# Altium project DTCP v3.0.PrjPcb (part 1 of 2)
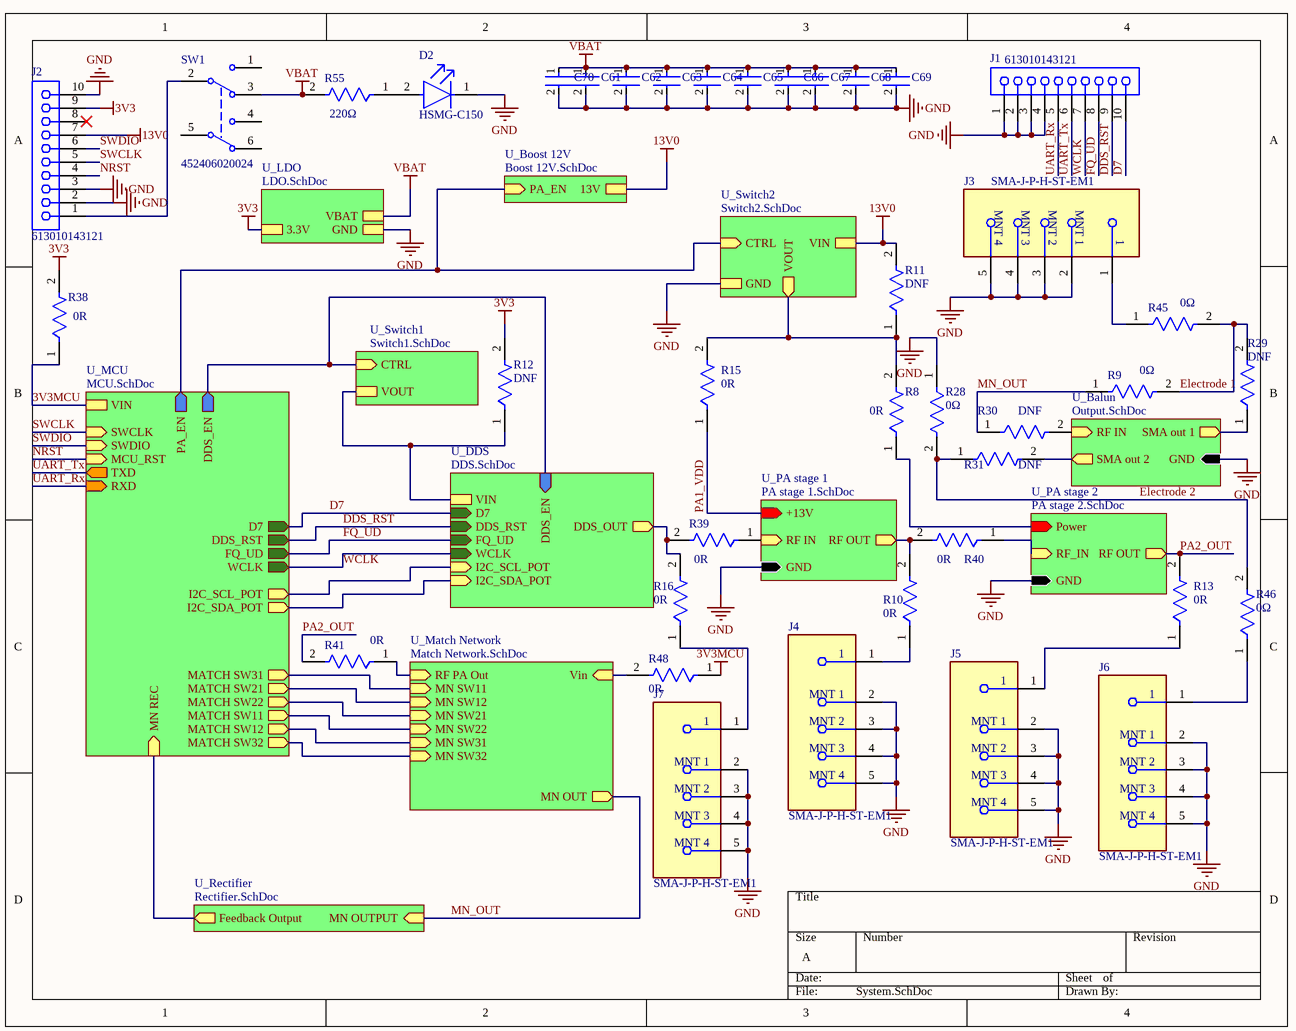
[diagram p0: System.SchDoc]
12 sheets, 165 parts. Net scope: hierarchical (ports join the sheet entries above them; power ports are global).
Board files: PCB1.PcbDoc, PCBv2.PcbDoc
Sheets:
  System.SchDoc
    U_MCU = MCU.SchDoc
    U_DDS = DDS.SchDoc
    U_PA stage 1 = PA stage 1.SchDoc
    U_PA stage 2 = PA stage 2.SchDoc
    U_LDO = LDO.SchDoc
    U_Boost 12V = Boost 12V.SchDoc
    U_Switch1 = Switch1.SchDoc
    U_Switch2 = Switch2.SchDoc
    U_Rectifier = Rectifier.SchDoc
    U_Balun = Output.SchDoc
    U_Match Network = Match Network.SchDoc

## Sheet System.SchDoc
size A; SheetNumber: 1; SheetTotal: 12

### Parts
C61  GRM21BR60J107ME15K  [FP-GRM21B-0_2-e0_2_0_7-IPC_B]  (value not drawn)
C62  GRM21BR60J107ME15K  [FP-GRM21B-0_2-e0_2_0_7-IPC_B]  (value not drawn)
C63  GRM21BR60J107ME15K  [FP-GRM21B-0_2-e0_2_0_7-IPC_B]  (value not drawn)
C64  GRM21BR60J107ME15K  [FP-GRM21B-0_2-e0_2_0_7-IPC_B]  (value not drawn)
C65  GRM21BR60J107ME15K  [FP-GRM21B-0_2-e0_2_0_7-IPC_B]  (value not drawn)
C66  GRM21BR60J107ME15K  [FP-GRM21B-0_2-e0_2_0_7-IPC_B]  (value not drawn)
C67  GRM21BR60J107ME15K  [FP-GRM21B-0_2-e0_2_0_7-IPC_B]  (value not drawn)
C68  GRM21BR60J107ME15K  [FP-GRM21B-0_2-e0_2_0_7-IPC_B]  (value not drawn)
C69  GRM21BR60J107ME15K  [FP-GRM21B-0_2-e0_2_0_7-IPC_B]  (value not drawn)
C70  GRM21BR60J107ME15K  [FP-GRM21B-0_2-e0_2_0_7-IPC_B]  (value not drawn)
D2  HSMG-C150  [FP-HSMG-C150-MFG]
J1  613010143121  [613010143121]
J2  613010143121  [613010143121]
J3  SMA-J-P-H-ST-EM1  [FP-SMA-J-P-H-ST-EM1-MFG]
J4  SMA-J-P-H-ST-EM1  [FP-SMA-J-P-H-ST-EM1-MFG]
J5  SMA-J-P-H-ST-EM1  [FP-SMA-J-P-H-ST-EM1-MFG]
J6  SMA-J-P-H-ST-EM1  [FP-SMA-J-P-H-ST-EM1-MFG]
J7  SMA-J-P-H-ST-EM1  [FP-SMA-J-P-H-ST-EM1-MFG]
R8  Resistance: 0R  [FP-RMCF0603-IPC_B]  (hidden comment: RMCF0603ZG0R00)
R9  Resistance: 0Ω  [FP-RMCF0603-IPC_B]  (hidden comment: RMCF0603ZG0R00)
R10  Resistance: 0R  [FP-RMCF0603-IPC_B]  (hidden comment: RMCF0603ZG0R00)
R11  DNF  [FP-RMCF0603-IPC_B]
R12  DNF  [FP-RMCF0603-IPC_B]
R13  Resistance: 0R  [FP-RMCF0603-IPC_B]  (hidden comment: RMCF0603ZG0R00)
R15  Resistance: 0R  [FP-RMCF0603-IPC_B]  (hidden comment: RMCF0603ZG0R00)
R16  Resistance: 0R  [FP-RMCF0603-IPC_B]  (hidden comment: RMCF0603ZG0R00)
R28  Resistance: 0Ω  [FP-RMCF0603-IPC_B]  (hidden comment: RMCF0603ZG0R00)
R29  DNF  [FP-RMCF0603-IPC_B]
R30  DNF  [FP-RMCF0603-IPC_B]
R31  DNF  [FP-RMCF0603-IPC_B]
R38  Resistance: 0R  [FP-RMCF0603-IPC_B]  (hidden comment: DNF)
R39  Resistance: 0R  [FP-RMCF0603-IPC_B]  (hidden comment: DNF)
R40  Resistance: 0R  [FP-RMCF0603-IPC_B]  (hidden comment: DNF)
R41  Resistance: 0R  [FP-RMCF0603-IPC_B]  (hidden comment: DNF)
R45  Resistance: 0Ω  [FP-RMCF0603-IPC_B]  (hidden comment: RMCF0603ZG0R00)
R46  Resistance: 0Ω  [FP-RMCF0603-IPC_B]  (hidden comment: RMCF0603ZG0R00)
R48  Resistance: 0R  [FP-RMCF0603-IPC_B]  (hidden comment: DNF)
R55  Resistance: 220Ω  [FP-CRCW0603-HPe3-IPC_A]  (hidden comment: CRCW0603220RFKEAHP)
SW1  452406020024  [452406020024]

### Sub-sheets
U_Balun = Output.SchDoc: RF IN (in), SMA out 1 (out), SMA out 2 (out), GND (in)
U_Boost 12V = Boost 12V.SchDoc: PA_EN (in), 13V
U_DDS = DDS.SchDoc: DDS_OUT (out), D7 (in), DDS_RST (in), FQ_UD (in), WCLK (in), I2C_SCL_POT (in), I2C_SDA_POT (in), DDS_EN (in), VIN
U_LDO = LDO.SchDoc: 3.3V, VBAT, GND
U_Match Network = Match Network.SchDoc: RF PA Out (in), MN SW11 (in), MN SW12 (in), MN SW21 (in), MN OUT (out), Vin (in), MN SW22 (in), MN SW31 (in), MN SW32 (in)
U_MCU = MCU.SchDoc: SWCLK (in), SWDIO (in), MCU_RST (in), TXD (out), D7 (out), DDS_RST (out), FQ_UD (out), WCLK (out), PA_EN (out), DDS_EN (out), RXD (in), I2C_SCL_POT (out), I2C_SDA_POT (out), MN REC (in), VIN, MATCH SW31 (out), MATCH SW21 (out), MATCH SW22 (out), MATCH SW11 (out), MATCH SW12 (out), MATCH SW32 (out)
U_PA stage 1 = PA stage 1.SchDoc: RF IN (in), RF OUT (out), GND (in), +13V (in)
U_PA stage 2 = PA stage 2.SchDoc: GND (in), Power (in), RF_IN (in), RF OUT (out)
U_Rectifier = Rectifier.SchDoc: MN OUTPUT (in), Feedback Output (out)
U_Switch1 = Switch1.SchDoc: CTRL (in), VOUT
U_Switch2 = Switch2.SchDoc: CTRL (in), VOUT (out), VIN, GND

### Nets
3V3: J2.9 R12.2 R38.2 ; sheet U_LDO/3.3V
3V3DDS: R12.1 ; sheet U_DDS/VIN, sheet U_Switch1/VOUT
3V3MCU: R38.1 R48.1 ; sheet U_MCU/VIN
3V3MN: R48.2 ; sheet U_Match Network/Vin
13V0: J2.7 R11.2 ; sheet U_Boost 12V/13V, sheet U_Switch2/VIN
13V0PA: R8.1 ; sheet U_PA stage 2/Power
GND: C61.2 C62.2 C63.2 C64.2 C65.2 C66.2 C67.2 C68.2 C69.2 C70.2 D2.1(C) J1.1 J1.2 J1.3 J1.4 J2.2 J2.3 J2.10 J3.2(MNT_1) J3.3(MNT_2) J3.4(MNT_3) J3.5(MNT_4) J4.2(MNT_1) J4.3(MNT_2) J4.4(MNT_3) J4.5(MNT_4) J5.2(MNT_1) J5.3(MNT_2) J5.4(MNT_3) J5.5(MNT_4) J6.2(MNT_1) J6.3(MNT_2) J6.4(MNT_3) J6.5(MNT_4) J7.2(MNT_1) J7.3(MNT_2) J7.4(MNT_3) J7.5(MNT_4) R28.1 ; sheet U_PA stage 1/GND, sheet U_PA stage 2/GND, sheet U_LDO/GND, sheet U_Switch2/GND, sheet U_Balun/GND
PA1_VDD: R15.1 ; sheet U_PA stage 1/+13V
VBAT: C61.1 C62.1 C63.1 C64.1 C65.1 C66.1 C67.1 C68.1 C69.1 C70.1 R55.2 SW1.3 ; sheet U_LDO/VBAT
D7: J1.10 ; sheet U_MCU/D7, sheet U_DDS/D7
DDS_OUT: R16.2 R39.2 ; sheet U_DDS/DDS_OUT
DDS_RST: J1.9 ; sheet U_MCU/DDS_RST, sheet U_DDS/DDS_RST
Electrode 1: R9.2 R29.2 R45.2
Electrode 2: R28.2 R31.1 R46.2
FQ_UD: J1.8 ; sheet U_MCU/FQ_UD, sheet U_DDS/FQ_UD
I2C_SCL_MCU: sheet U_MCU/I2C_SCL_POT, sheet U_DDS/I2C_SCL_POT
I2C_SDA_MCU: sheet U_MCU/I2C_SDA_POT, sheet U_DDS/I2C_SDA_POT
MN_OUT: R9.1 R30.1 ; sheet U_Rectifier/MN OUTPUT, sheet U_Match Network/MN OUT
NRST: J2.4 ; sheet U_MCU/MCU_RST
PA2_OUT: R13.2 R41.2 ; sheet U_PA stage 2/RF OUT
SWCLK: J2.5 ; sheet U_MCU/SWCLK
SWDIO: J2.6 ; sheet U_MCU/SWDIO
UART_Rx: J1.5 ; sheet U_MCU/RXD
UART_Tx: J1.6 ; sheet U_MCU/TXD
WCLK: J1.7 ; sheet U_MCU/WCLK, sheet U_DDS/WCLK  [project net DDS_WCLK]
NetC26_1: R41.1 ; sheet U_Match Network/RF PA Out
NetC33_2: R10.2 R40.2 ; sheet U_PA stage 1/RF OUT
NetC34_1: R39.1 ; sheet U_PA stage 1/RF IN
NetC39_1: R40.1 ; sheet U_PA stage 2/RF_IN
NetD2_2: D2.2(A) R55.1
NetJ2_1: J2.1 SW1.2(COM)
NetJ3_1: J3.1 R45.1
NetJ4_1: J4.1 R10.1
NetJ5_1: J5.1 R13.1
NetJ6_1: J6.1 R46.1
NetJ7_1: J7.1 R16.1
NetL15_1: R31.2 ; sheet U_Balun/SMA out 2
NetL15_3: R29.1 ; sheet U_Balun/SMA out 1
NetL15_4: R30.2 ; sheet U_Balun/RF IN
NetR8_2: R8.2 R11.1 R15.2 ; sheet U_Switch2/VOUT
NetR14_1: sheet U_MCU/PA_EN, sheet U_Boost 12V/PA_EN, sheet U_Switch2/CTRL
NetR32_1: sheet U_MCU/MN REC, sheet U_Rectifier/Feedback Output
NetU1_9: sheet U_MCU/DDS_EN, sheet U_DDS/DDS_EN, sheet U_Switch1/CTRL
NetU1_14: sheet U_MCU/MATCH SW32, sheet U_Match Network/MN SW32
NetU1_17: sheet U_MCU/MATCH SW31, sheet U_Match Network/MN SW11
NetU1_18: sheet U_MCU/MATCH SW22, sheet U_Match Network/MN SW21
NetU1_19: sheet U_MCU/MATCH SW21, sheet U_Match Network/MN SW12
NetU1_20: sheet U_MCU/MATCH SW12, sheet U_Match Network/MN SW31
NetU1_21: sheet U_MCU/MATCH SW11, sheet U_Match Network/MN SW22

Not connected (* = marked no-connect by the designer): J2 8*; SW1 1 4 5(COM) 6

### Library data of the parts
C61-C70 = CMP-06035-052658-1: Chip Multilayer Ceramic Capacitors for General Purpose, 0805, 100uF, X5R, 15%, 20%, 6.3V; Voltage Rating (DC): 6.3V; Lead Free: Lead Free; Length: 2mm; Tolerance: 20%; Width: 1.25mm; Capacitance: 100uF; Dielectric: X5R; Thickness: 1.25mm
D2 = CMP-2000-05061-2: LED GREEN DIFFUSED 1206 SMD; Manufacturer: Broadcom; Led Orientation: Top View; Max Junction Temp: +95°C; Peak Emmision Wavelength: 570nm; Viewing Angle: 170°; Wavelength: 572nm; Reverse Voltage: 5V; Luminous Intensity: 15mcd; Forward Voltage: 2.2V; Power Dissipation: 65mW; Forward Current: 20mA; ComponentLink2Description: Datasheet; Lead Free: Yes; Temperature Range Low: -40°C; Package: HSMG-C150; Digikey Description: LED GREEN DIFFUSED 1206 SMD; Mouser Description: LED Uni-Color Green 570nm 2-Pin Chip LED T/R; Manufacturer Part Number: HSMG-C150; Temperature Range High: +85°C; Device Class L1: Optoelectronics; Colour: Green; Category: Diode; Device Class L3: unset; RoHS: TRUE; Height: 1.2mm; ComponentLink2URL: https://docs.broadcom.com/docs/AV02-0551EN; Device Class L2: LEDs; Automotive: No; Ipc Land Pattern Name: DIOCP320160X55; Octopart: https://octopart.com/hsmg-c150-broadcom-71131304; Temperature: -40°C to +85°C
J1 J2 = CMP-1502-01419-3: NexarPartId: 18818161; Operating Supply Voltage: 250V; Contact Resistance: 20mΩ; Gender: Female; Insulation Resistance: 1GΩ; Connector Type: Header, Socket; Insulation: Insulated; Current Rating: 3A; Number of Positions: 10; Pitch: 2.54mm; Number of Rows: 1; Number of Pins: 10; Voltage Rating: 250V; Length: 25.9mm; Contact Gender: Female; RoHS: Compliant; Contact Plating: Gold; Height: 8.5mm; Min Operating Temperature: -40°C; Contact Material: Copper; Number of Contacts: 10; REACH SVHC: Unknown; Mount: Through Hole; Lead Pitch: 2.54mm; Width: 25.9mm; Max Operating Temperature: 125°C; Flammability Rating: UL94 V-0; Termination: Through Hole; Color: Black; Housing Material: PBT
J3-J7 = CMP-02754-000006-1: CONN SMA JACK STR 50OHM EDGE MNT; Dielectric Material: PTFE; Center Contact Plating: Gold; Max Frequency: 6GHz; Body Material: Brass; Voltage Rating: 335V; Impedance: 50R; Package Quantity: 1; Case/Package: SMA; Max Operating Temperature: 125°C; Fastening Type: Threaded; Orientation: Straight; Depth: 13.33mm; RoHS Compliant: Yes; Length: 6.35mm; Insulation Material: Polytetrafluoroethylene; Termination: Solder; Min Operating Temperature: -65°C; Housing Color: Gold; Contact Plating: Gold; Contact Material: Copper; Connector Type: SMA; Mount: Edge; Series: SMA; Packaging: Tray; Body Plating: Gold; Radiation Hardening: No
R8-R10 R13 R15 R16 R28-R31 R38-R41 R45 R46 R48 = CMP-26527-006412-1: 0Ω ±0 0.1W 0603 Thick Film Chip Resistor AEC-Q200 compliant; Max Power Dissipation: 100mW; Width: 0.031inch; RoHS Compliant: Yes; Number of Terminations: 2; Case/Package: 0603; Contact Plating: Tin; Height: 0.022inch; Resistor Type: Thick Film; Mount: Surface Mount; Length: 0.061inch; Features: Automotive AEC-Q200; Series: RMCF; Max Operating Temperature: 155°C; Radiation Hardening: No; Min Operating Temperature: -55°C; Packaging: Tape and Reel
  R29-R31: Resistance: 0Ω
R11 R12 = CMP-26527-006412-1: 0Ω ±0 0.1W 0603 Thick Film Chip Resistor AEC-Q200 compliant; Max Power Dissipation: 100mW; Resistance: 0R; Width: 0.031inch; RoHS Compliant: Yes; Number of Terminations: 2; Case/Package: 0603; Contact Plating: Tin; Height: 0.022inch; Resistor Type: Thick Film; Mount: Surface Mount; Length: 0.061inch; Features: Automotive AEC-Q200; Series: RMCF; Max Operating Temperature: 155°C; Radiation Hardening: No; Min Operating Temperature: -55°C; Packaging: Tape and Reel
R55 = CMP-02407-003593-1: RES Thick Film, 220Ω, 1%, 0.33W, 100ppm/°C, 0603; Max Power Dissipation: 250mW; Voltage Rating (DC): 75V; Radiation Hardening: No; Contact Plating: Tin; Length: 1.6mm; Depth: 0.85mm; Composition: Thick Film; Lead Free: Lead Free; Mount: Surface Mount; Package Quantity: 5000; Height: 0.45mm; Termination: SMD/SMT; Weight: 7.1E-05oz; Military Standard: Not; Number of Terminations: 2; Case Code (Metric): 1608; Max Operating Temperature: 155°C; Power Rating: 250mW; Tolerance: 1%; Temperature Coefficient: 100ppm/°C; Features: Automotive AEC-Q200; Case Code (Imperial): 0603; Width: 0.033inch; Min Operating Temperature: -55°C; Case/Package: 0603; Voltage Rating: 75V; Packaging: Tape and Reel
SW1 = CMP-03913-146831046-1: Ws-slsv_smt Mini Slide Switch Sa

## Sheet MCU.SchDoc
size A; SheetNumber: 2; SheetTotal: 12
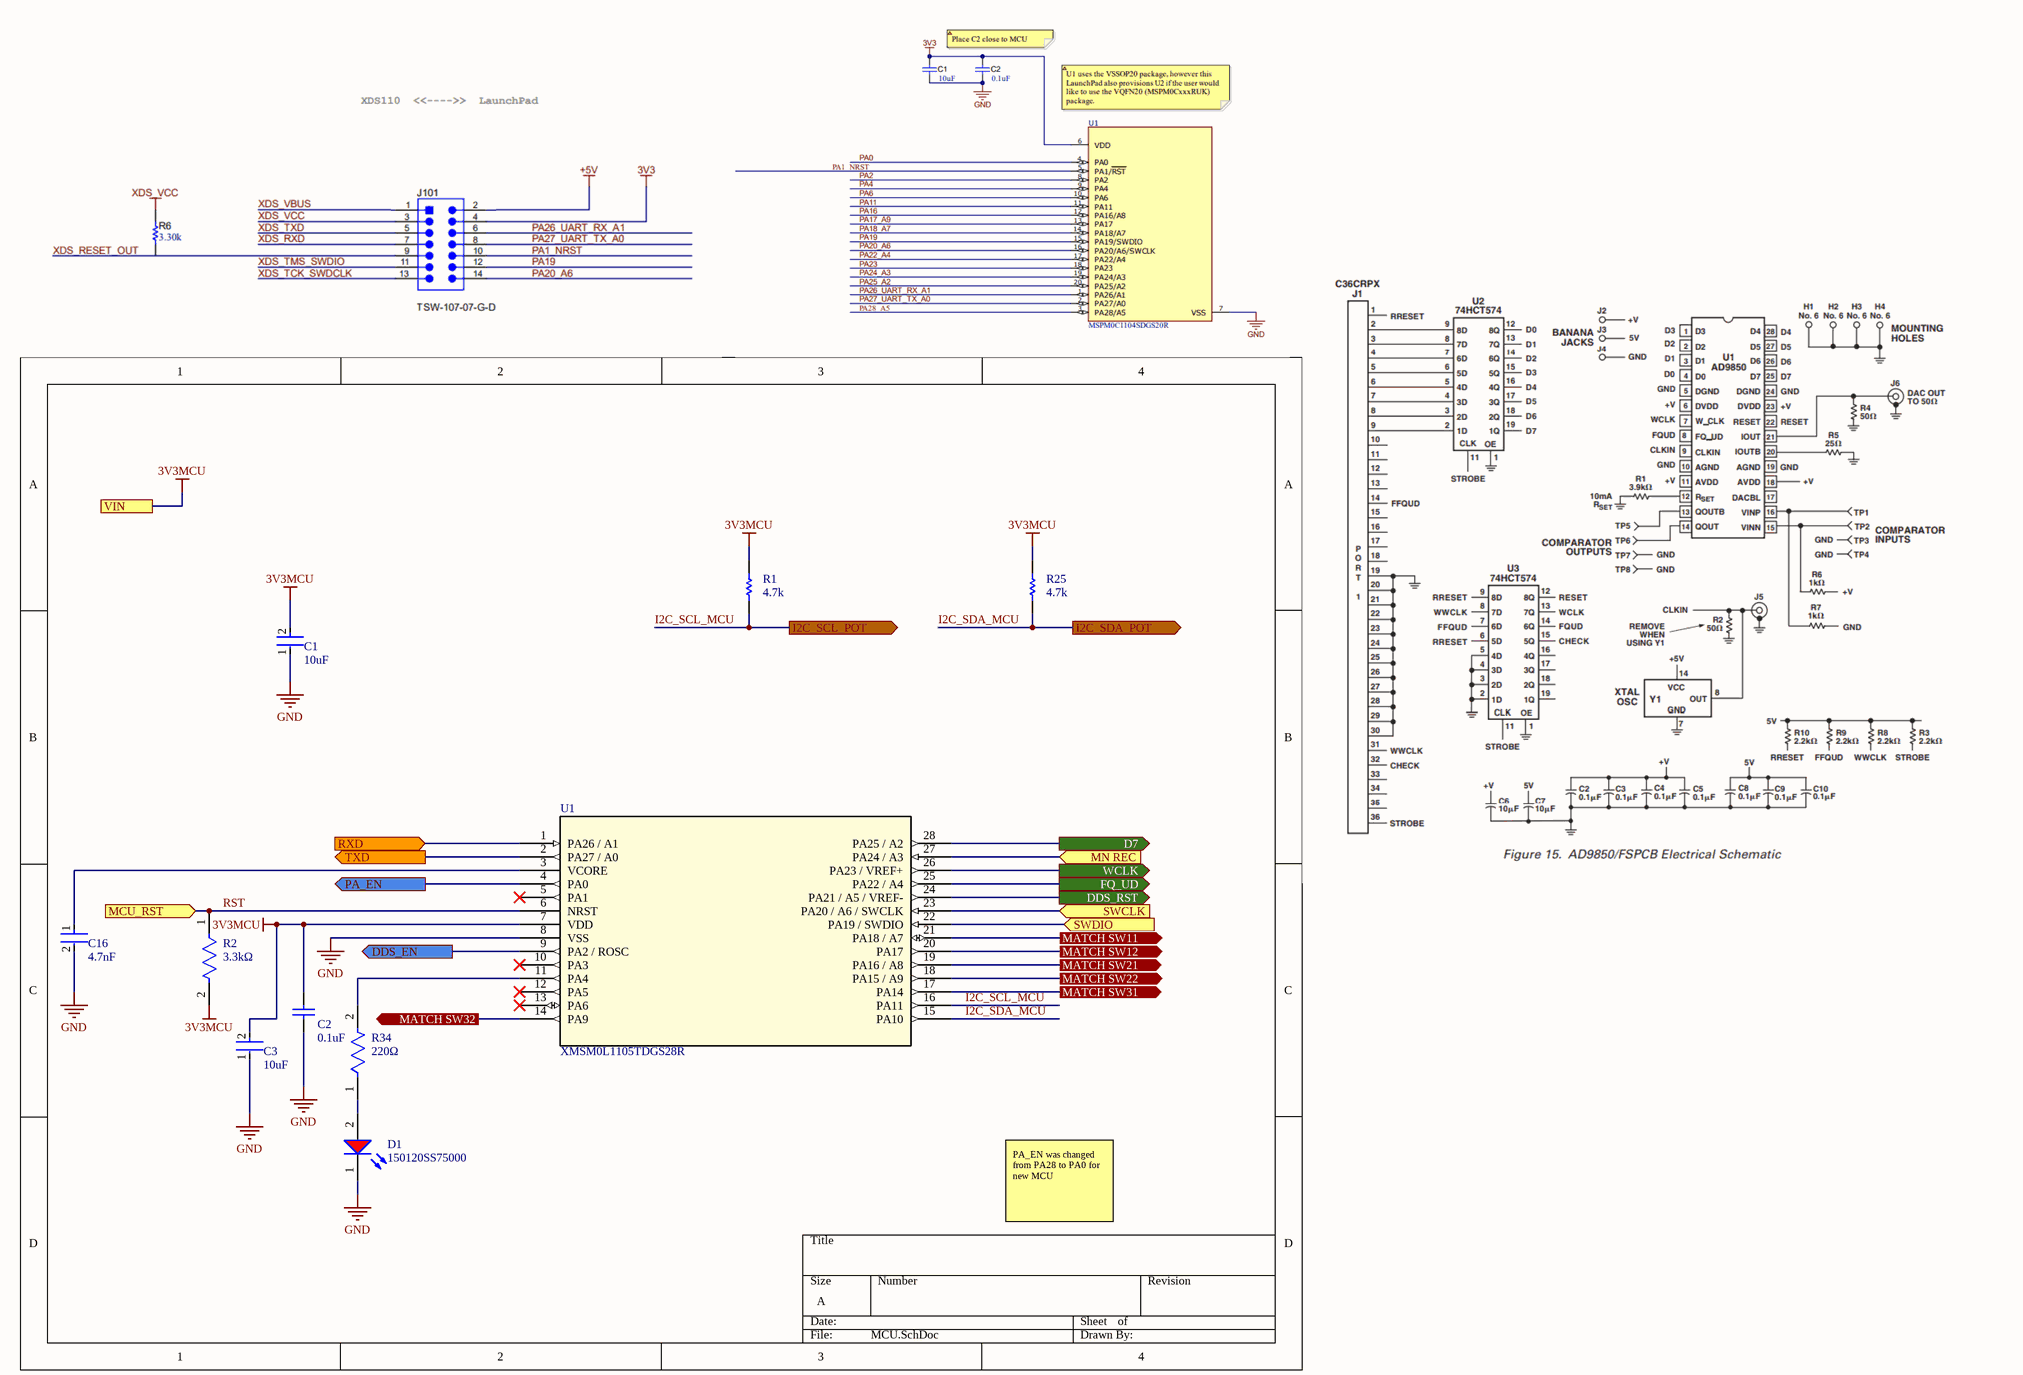
[diagram p1: MCU.SchDoc]

### Parts
C1  Capacitance: 10uF  [FP-C1608-080-0_1-MFG]  (hidden comment: C1608X5R1A106K080AC)
C2  value 0.1uF  [CAPC1608X92X38NL15T08]  (hidden comment: VJ0603Y104KXJAP)
C3  Capacitance: 10uF  [FP-C1608-080-0_1-MFG]  (hidden comment: C1608X5R1A106K080AC)
C16  Capacitance: 4.7nF  [FP-GRM188-0_1-e0_2_0_5-MFG]  (hidden comment: GRM1885C1H472JA01D)
D1  150120SS75000  [WL-SMCW_1206_150120xx75000]
R1  Resistance: 4.7k  [RESC1608X55X25LL10T15]  (hidden comment: RC0603FR-074K7L)
R2  Resistance: 3.3kΩ  [FP-ESR03-IPC_A]  (hidden comment: ESR03EZPF3301)
R25  Resistance: 4.7k  [RESC1608X55X25LL10T15]  (hidden comment: RC0603FR-074K7L)
R34  Resistance: 220Ω  [FP-CRCW0603-HPe3-IPC_A]  (hidden comment: CRCW0603220RFKEAHP)
U1  XMSM0L1105TDGS28R  [VSSOP28_DGS_TEX]

### Ports
D7 (out), DDS_EN (out), DDS_RST (out), FQ_UD (out), I2C_SCL_POT (out), I2C_SDA_POT (out), MATCH SW11 (out), MATCH SW12 (out), MATCH SW21 (out), MATCH SW22 (out), MATCH SW31 (out), MATCH SW32 (out), MCU_RST (in), MN REC (in), PA_EN (out), RXD (in), SWCLK (in), SWDIO (in), TXD (out), VIN, WCLK (out)

### Nets
3V3MCU: C1.2 C2.2 C3.2 R1.2 R2.2 R25.2 U1.7(VDD) ; port VIN
GND: C1.1 C2.1 C3.1 C16.2 D1.1(K) U1.8(VSS)
D7: U1.28(PA25_/_A2) ; port D7
DDS_RST: U1.24(PA21_/_A5_/_VREF-) ; port DDS_RST
DDS_WCLK: U1.26(PA23_/_VREF+) ; port WCLK
FQ_UD: U1.25(PA22_/_A4) ; port FQ_UD
I2C_SCL_MCU: R1.1 U1.16(PA11) ; port I2C_SCL_POT
I2C_SDA_MCU: R25.1 U1.15(PA10) ; port I2C_SDA_POT
RST: R2.1 U1.6(NRST) ; port MCU_RST  [project net NRST]
SWCLK: U1.23(PA20_/_A6_/_SWCLK) ; port SWCLK
SWDIO: U1.22(PA19_/_SWDIO) ; port SWDIO
UART_Rx: U1.1(PA26_/_A1) ; port RXD
UART_Tx: U1.2(PA27_/_A0) ; port TXD
NetC16_1: C16.1 U1.3(VCORE)
NetD1_2: D1.2(A) R34.1
NetR14_1: U1.4(PA0) ; port PA_EN
NetR32_1: U1.27(PA24_/_A3) ; port MN REC
NetR34_2: R34.2 U1.11(PA4)
NetU1_9: U1.9(PA2_/_ROSC) ; port DDS_EN
NetU1_14: U1.14(PA9) ; port MATCH SW32
NetU1_17: U1.17(PA14) ; port MATCH SW31
NetU1_18: U1.18(PA15_/_A9) ; port MATCH SW22
NetU1_19: U1.19(PA16_/_A8) ; port MATCH SW21
NetU1_20: U1.20(PA17) ; port MATCH SW12
NetU1_21: U1.21(PA18_/_A7) ; port MATCH SW11

Not connected (* = marked no-connect by the designer): U1 5(PA1)* 10(PA3)* 12(PA5)* 13(PA6)*

### Notes on the sheet
- PA_EN was changed from PA28 to PA0 for new MCU

### Library data of the parts
C1 C3 = CMP-2000-04979-3: Multilayer Ceramic Capacitors 10μF ±10% 10V X5R SMD 0603; Dielectric Material: Ceramic; Construction: Flat; Height: 0.8mm; Thickness: 0.035inch; Case Code (Metric): 1608; Radiation Hardening: No; Number of Pins: 2; Voltage Rating (DC): 10V; Depth: 0.8mm; Voltage: 10V; RoHS Compliant: Yes; Voltage Rating: 10V; Package Quantity: 1; Resistor Type: Ceramic; Termination: SMD/SMT; Lead Free: Lead Free; REACH SVHC: No SVHC; Tolerance: 10%; Mount: Surface Mount; Series: C; Packaging: Tape and Reel; Width: 0.8mm; Dielectric: X5R; Weight: 7.1E-05oz; Length: 1.6mm; Max Operating Temperature: 85°C; Case Code (Imperial): 0603; Case/Package: 0603; Min Operating Temperature: -55°C
C2 = CMP-2006-01211-1: Manufacturer: Vitramon; Part Number: VJ0603Y104KXJAP
C16 = CMP-2006-02564-2: Chip Multilayer Ceramic Capacitors for General Purpose, 0603, 4700pF, C0G, 30ppm/°C, 5%, 50V; Case Code (Imperial): 0603; Width: 0.8mm; Package Quantity: 4000; Termination: SMD/SMT; Lead Free: Lead Free; Voltage Rating (DC): 50V; Dielectric: C0G; Height: 0.8mm; Tolerance: 5%; Thickness: 0.035inch; Min Operating Temperature: -55°C; Voltage Rating: 50V; Mount: Surface Mount; Max Operating Temperature: 125°C; Case Code (Metric): 1608; REACH SVHC: No SVHC; Material: Ceramic; Length: 1.6mm; Packaging: Tape and Reel; Case/Package: 0603
D1 = CMP-1426-00017-3: Led, Red, 630 Nm, 1.9 V, 30 Ma, 60 Mcd Rohs Compliant: Yes; Forward Current: 100mA; Max Reverse Voltage (DC): 5V; Lens Style: Clear, Rectangular; Viewing Angle: 140°; Luminous Intensity: 60mcd; Peak Wavelength: 645nm; Forward Voltage: 1.9V; Test Current: 20mA; Dominant Wavelength: 630nm; Case Code (Imperial): 1206; Length: 3.2mm; Mount: Surface Mount; Case Code (Metric): 3216; Case/Package: 1206; Min Operating Temperature: -40°C; Width: 1.6mm; Color: Red; Height: 680µm; REACH SVHC: Unknown; Max Operating Temperature: 85°C; Wavelength: 630nm; RoHS: Compliant; Packaging: Tape and Reel
R1 R25 = CMP-2000-06942-1: Chip Resistor, 4.7 KOhm, +/- 1%, 0.1 W, -55 to 155 degC, 0603 (1608 Metric), RoHS, Tape and Reel; Manufacturer: Yageo; Power Rating: 100mW; Temperature Coefficient: 100PPM/C; Voltage Rating: 50V; Package Reference: 0603; Series: RC; Datasheet Version: Rev. 7, 05/2017; Packaging: Reel; Termination Style: SMD/SMT; Datasheet URL: http://www.yageo.com/documents/recent/PYu-RC_Group_51_RoHS_L_7.pdf; Manufacturer URL: http://www.yageo.com/; Package Description: 2-Pin Surface Mount Device, Body 1.6 x 0.8 mm; Case Code - mm: 1608; Case Code - in: 0603; Mounting Technology: SurfaceMount; Operating Temperature Range: -55Cto+155C; Tolerance: 1%; Product: ThickFilmResistorsGeneralPurpose
R2 = CMP-08839-028747-1: 3.3kΩ ±1% 0.25W 0603 Anti-Surge Chip Resistor AEC-Q200; Temperature Coefficient: 100ppm/°C; Max Power Dissipation: 250mW; Tolerance: 1%; Min Operating Temperature: -55°C; Features: Automotive AEC-Q200; Max Operating Temperature: 155°C; Number of Terminations: 2; Series: ESR; Packaging: Tape and Reel; Resistor Type: Thick Film; RoHS Compliant: Yes; Case/Package: 0603
R34 = CMP-02407-003593-1: as R55 on sheet System; Radiation Hardening: No; Contact Plating: Tin; Length: 1.6mm; Depth: 0.85mm; Composition: Thick Film; Lead Free: Lead Free; Mount: Surface Mount; Package Quantity: 5000; Height: 0.45mm; Termination: SMD/SMT; Weight: 7.1E-05oz; Military Standard: Not; Number of Terminations: 2; Case Code (Metric): 1608; Max Operating Temperature: 155°C; Power Rating: 250mW; Tolerance: 1%; Temperature Coefficient: 100ppm/°C; Features: Automotive AEC-Q200; Case Code (Imperial): 0603; Width: 0.033inch; Min Operating Temperature: -55°C; Case/Package: 0603; Voltage Rating: 75V; Packaging: Tape and Reel
U1 = XMSM0L1105TDGS28R: 32-MHz ArmÂ® CortexÂ®-M0+ MCU with 32-KB flash, 4-KB SRAM, 12-bit ADC 28-VSSOP -40 to 105; Manufacturer_Name: Texas Instruments; Type: Embedded; Copyright: Copyright (C) 2026 Ultra Librarian. All rights reserved.; Manufacturer_Part_Number: XMSM0L1105TDGS28R; RefDes: RefDes

## Sheet DDS.SchDoc
size A; SheetNumber: 8; SheetTotal: 12
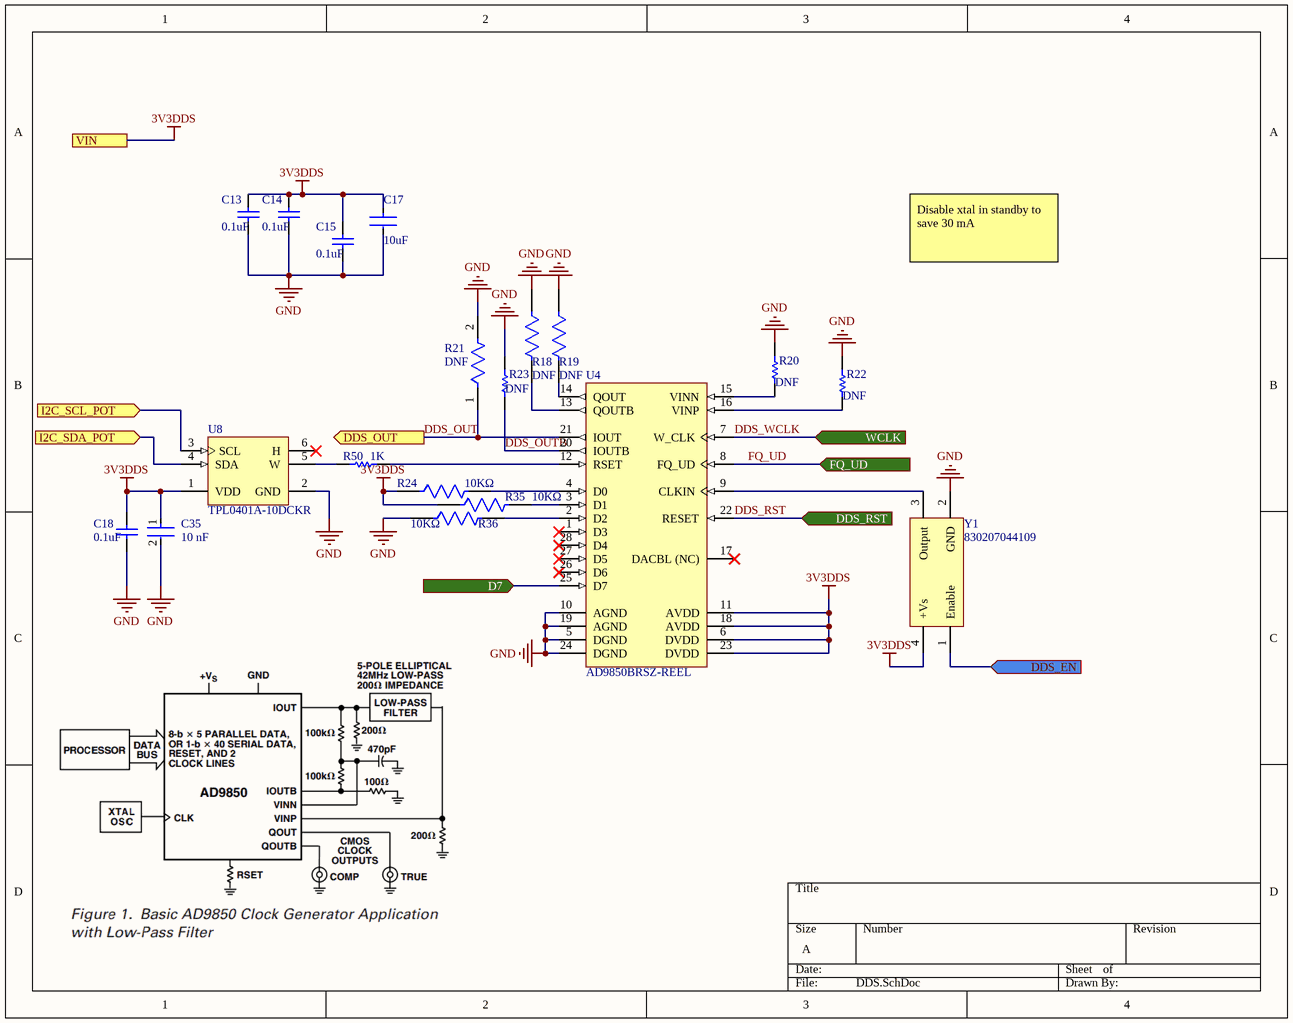
[diagram p2: DDS.SchDoc]

### Parts
C13  value 0.1uF  [CAPC1608X92X38NL15T08]  (hidden comment: VJ0603Y104KXJAP)
C14  value 0.1uF  [CAPC1608X92X38NL15T08]  (hidden comment: VJ0603Y104KXJAP)
C15  value 0.1uF  [CAPC1608X92X38NL15T08]  (hidden comment: VJ0603Y104KXJAP)
C17  Capacitance: 10uF  [FP-C1608-080-0_1-MFG]  (hidden comment: C1608X5R1A106K080AC)
C18  value 0.1uF  [CAPC1608X92X38NL15T08]  (hidden comment: VJ0603Y104KXJAP)
C35  value 10 nF  [FP-CC0603-DA-MFG]  (hidden comment: CC0603KRX7R9BB103)
R18  DNF  [FP-RMCF0603-IPC_B]
R19  DNF  [FP-RMCF0603-IPC_B]
R20  DNF  [RESC1608X55X30LL15T15]
R21  DNF  [FP-CRCW0603-e3-MFG]
R22  DNF  [RESC1608X55X30LL15T15]
R23  DNF  [6-0805_N]
R24  Resistance: 10KΩ  [FP-CRGCQ0603-IPC_C]  (hidden comment: CRGCQ0603J10K)
R35  Resistance: 10KΩ  [FP-CRGCQ0603-IPC_C]  (hidden comment: CRGCQ0603J10K)
R36  Resistance: 10KΩ  [FP-CRGCQ0603-IPC_C]  (hidden comment: CRGCQ0603J10K)
R50  Resistance: 1K  [RESC1608X55X30LL15T15]  (hidden comment: ERJ-3EKF1001V)
U4  AD9850BRSZ-REEL  [ADI-RS-28_N]
U8  TPL0401A-10DCKR  [TI-DCK6_V]
Y1  830207044109  [WE-SPXO_CFPS-39]

### Ports
D7 (in), DDS_EN (in), DDS_OUT (out), DDS_RST (in), FQ_UD (in), I2C_SCL_POT (in), I2C_SDA_POT (in), VIN, WCLK (in)

### Nets
3V3DDS: C13.2 C14.2 C15.2 C17.2 C18.2 C35.1 R24.1 R35.1 U4.6(DVDD) U4.11(AVDD) U4.18(AVDD) U4.23(DVDD) U8.1(VDD) Y1.4(+Vs) ; port VIN
GND: C13.1 C14.1 C15.1 C17.1 C18.1 C35.2 R18.1 R19.1 R20.2 R21.2 R22.2 R23.2 R36.1 U4.5(DGND) U4.10(AGND) U4.19(AGND) U4.24(DGND) U8.2(GND) Y1.2(GND)
D7: U4.25(D7) ; port D7
DDS_OUT: R21.1 U4.21(IOUT) ; port DDS_OUT
DDS_OUTB: R23.1 U4.20(IOUTB)
DDS_RST: U4.22(RESET) ; port DDS_RST
DDS_WCLK: U4.7(W_CLK) ; port WCLK
FQ_UD: U4.8(FQ_UD) ; port FQ_UD
I2C_SCL_MCU: U8.3(SCL) ; port I2C_SCL_POT
I2C_SDA_MCU: U8.4(SDA) ; port I2C_SDA_POT
NetR18_2: R18.2 U4.13(QOUTB)
NetR19_2: R19.2 U4.14(QOUT)
NetR20_1: R20.1 U4.15(VINN)
NetR22_1: R22.1 U4.16(VINP)
NetR24_2: R24.2 U4.4(D0)
NetR35_2: R35.2 U4.3(D1)
NetR36_2: R36.2 U4.2(D2)
NetR50_1: R50.1 U8.5(W)
NetR50_2: R50.2 U4.12(RSET)
NetU1_9: Y1.1(Enable) ; port DDS_EN
NetU4_9: U4.9(CLKIN) Y1.3(Output)

Not connected (* = marked no-connect by the designer): U4 1(D3)* 17(DACBL_(NC))* 26(D6)* 27(D5)* 28(D4)*; U8 6(H)*

### Notes on the sheet
- Disable xtal in standby to save 30 mA

### Library data of the parts
C13-C15 C18 = CMP-2006-01211-1: Manufacturer: Vitramon; Part Number: VJ0603Y104KXJAP
C17 = CMP-2000-04979-3: as C1 on sheet MCU; Dielectric Material: Ceramic; Construction: Flat; Height: 0.8mm; Thickness: 0.035inch; Case Code (Metric): 1608; Radiation Hardening: No; Number of Pins: 2; Voltage Rating (DC): 10V; Depth: 0.8mm; Voltage: 10V; RoHS Compliant: Yes; Voltage Rating: 10V; Package Quantity: 1; Resistor Type: Ceramic; Termination: SMD/SMT; Lead Free: Lead Free; REACH SVHC: No SVHC; Tolerance: 10%; Mount: Surface Mount; Series: C; Packaging: Tape and Reel; Width: 0.8mm; Dielectric: X5R; Weight: 7.1E-05oz; Length: 1.6mm; Max Operating Temperature: 85°C; Case Code (Imperial): 0603; Case/Package: 0603; Min Operating Temperature: -55°C
C35 = CMP-2100-03600-2: CAP CER 10000PF 50V X7R 0603; Manufacturer: YAGEO; Tolerance: 0.1; Material: Ceramic; Temperature Coefficient: 15%; Description: CC0603 10 nF X7R 10.00% 50 V; Mouser Description: Multilayer Ceramic Capacitor, CC Series, 0.01 - F, - 10%, X7R, 50 V, 0603 [1608 Metric]; Digikey Description: CAP CER 10000PF 50V X7R 0603; Height: 0.9mm; Category: Cap; Temperature Characteristic: X7R; Footprint Url: http://www.yageo.com/exep/pages/download/literatures/UPY-C_GEN_24.pdf; Lead Free: Yes; Voltage Rating: 50 V; Manufacturer Part Number: CC0603KRX7R9BB103; Temperature: -55°C to +125°C; Device Class L3: Ceramic Capacitors; ComponentLink2Description: Datasheet; Voltage: 50 V; Package: CC0603-DA; Octopart: https://octopart.com/cc0603krx7r9bb103-yageo-192938; Automotive: No; Temperature Range High: +125°C; Temperature Range Low: -55°C; RoHS: TRUE; Device Class L1: Passive Components; ComponentLink2URL: http://www.yageo.com/documents/recent/UPY-GPHC_X7R_6.3V-to-50V_18.pdf; Device Class L2: Capacitors; Capacitance: 10 nF
R18 R19 = CMP-26527-006412-1: as R11 on sheet System; Width: 0.031inch; RoHS Compliant: Yes; Number of Terminations: 2; Case/Package: 0603; Contact Plating: Tin; Height: 0.022inch; Resistor Type: Thick Film; Mount: Surface Mount; Length: 0.061inch; Features: Automotive AEC-Q200; Series: RMCF; Max Operating Temperature: 155°C; Radiation Hardening: No; Min Operating Temperature: -55°C; Packaging: Tape and Reel
R20 R22 = CMP-2000-00180-1: ERJ-3EKF1001V; Manufacturer: Panasonic; Resistance: 1K; Part Number: ERJ-3EKF1001V
R21 = CMP-2000-03436-2: RES Thick Film, 50Ω, 1%, 0.1W, 100ppm/°C, 0603 CRCW060350R0FKEA; Voltage Rating (DC): 75V; Resistance: 50; Power Rating: 100mW; Case/Package: 0603; Packaging: Tape and Reel; Military Standard: Not; REACH SVHC: No SVHC; Width: 0.85mm; Max Operating Temperature: 155°C; Case Code (Metric): 1608; Temperature Coefficient: 100ppm/°C; Lead Free: Lead Free; Height: 0.45mm; Composition: Thick Film; Termination: SMD/SMT; Contact Plating: Tin; Number of Pins: 2; Tolerance: 1%; Depth: 0.85mm; Weight: 7.1E-05oz; Min Operating Temperature: -55°C; Length: 1.55mm; Radiation Hardening: No; Voltage Rating: 75V; Case Code (Imperial): 0603; Package Quantity: 5000; Mount: Surface Mount
R23 = Resistor: Fixed Resistor, Thin Film, 0.125W, 25ohm, 150V, 0.1% +/-Tol, 25ppm/Cel, Surface Mount, 0805; Manufacturer: Yageo Group; Manufacturer Part Number: RT0805BRD0725RL; TC1: 0; SimulationGenericComponent: True; Value: 25; Power Rating: 125mW; Temperature Coefficient: 25ppm/°C; TC2: 0; Supplier: Avnet; Supplier Part Number: RT0805BRD0725RL; RoHS: Compliant; Category: Chip SMD Resistors; Pricing: 5000=0.0492, 10000=0.04895, 20000=0.04869, 40000=0.04844, 80000=0.04819 (USD); Case/Package: 0805; China RoHS: Non-Compliant; Composition: Thin Film; Country of Origin: Mainland China, Taiwan; Export Control Classification Number (ECCN) Code: EAR99; Height: 500µm; Harmonized Tariff Schedule (HTS) Code: 8533.21.00.30; Introduction Date: 2020-04-21; Length: 2mm; Lifecycle Status: Production; Max Operating Temperature: 155°C; Min Operating Temperature: -55°C; Mounting Technology: Surface Mount; Number of Terminals: 2; Packaging: Tape & Reel; REACH SVHC: Unaffected; Tolerance: 0.1%; Width: 1.25mm; Working Voltage: 150V; ComponentLink1URL: https://datasheet.octopart.com:443/RT0805BRD0725RL-Yageo-Group-datasheet-176402239.pdf?src-supplier=IHS; ComponentLink1Description: https://datasheet.octopart.com:443/RT0805BRD0725RL-Yageo-Group-datasheet-176402239.pdf?src-supplier=IHS; ComponentLink2URL: https://datasheet.octopart.com:443/RT0805BRD0725RL-Yageo-datasheet-141265893.pdf?src-supplier=IHS; ComponentLink2Description: https://datasheet.octopart.com:443/RT0805BRD0725RL-Yageo-datasheet-141265893.pdf?src-supplier=IHS; ComponentLink3URL: https://datasheet.octopart.com/RT0805BRD0725RL-Yageo-datasheet-86813807.pdf; ComponentLink3Description: https://datasheet.octopart.com/RT0805BRD0725RL-Yageo-datasheet-86813807.pdf; ComponentLink4URL: http://sigma.octopart.com:80/conflict_mineral_statement/Yageo-company-3.pdf?src-supplier=Compliance+Statements; ComponentLink4Description: http://sigma.octopart.com:80/conflict_mineral_statement/Yageo-company-3.pdf?src-supplier=Compliance+Statements; ComponentLink5URL: http://sigma.octopart.com:80/rohs_statement/Yageo-company-2.pdf?src-supplier=Compliance+Statements; ComponentLink5Description: http://sigma.octopart.com:80/rohs_statement/Yageo-company-2.pdf?src-supplier=Compliance+Statements
R24 R35 R36 = CMP-03211-009884-1: CRGCQ 0603 10K 5%; Manufacturer: TE Connectivity; Tolerance: 0.05; Power Rating: 0.1W; Voltage Rating: 75V; Value: 10KΩ; Temperature Coefficient: ±100ppm/°C; Composition: Thick Film; ComponentLink2URL: https://www.te.com/commerce/DocumentDelivery/DDEController?Action=showdoc&DocId=Data+Sheet%7F1773204-3%7F1%7Fpdf%7FEnglish%7FENG_DS_1773204-3_1.pdf%7F4-2176339-923; Device Class L1: Passive Components; Package: CRGCQ0603; Mouser Description: Res Thick Film 0603 10K Ohm 5% 0.1W(1/10W) ±100ppm/C Pad SMD Automotive T/R; Temperature Range High: +155°C; Category: Res; Device Class L2: Resistors; Height: 0.55mm; RoHS: TRUE; Lead Free: Yes; Ipc Land Pattern Name: RESC16080X45; Temperature: -55°C to +155°C; Series: CRGCQ; Digikey Description: CRGCQ 0603 10K 5%; Octopart: https://octopart.com/crgcq0603j10k-te+connectivity-91018097; Device Class L3: Chip SMD Resistors; Ambient Temperature Range High: +70°C; ComponentLink2Description: Datasheet; Temperature Range Low: -55°C; Manufacturer Part Number: CRGCQ0603J10K
R50 = CMP-2000-00180-1: Manufacturer: Panasonic; Part Number: ERJ-3EKF1001V
U4 = CMP-0293-00041-1: CMOS, 125 MHz Complete DDS Synthesizer, 10-Bit, Parallel, Serial, RS-28, 1500 Reel, Pb-Free; Tuning Word Width (bits): 32bit; Master fclk: 125MHz; Resolution (Bits): 10bit; REFCLK Multiplier: No; Compliance Range (V): 1.5V; FS Iout (mA nom): 20mA; I Supply total (max): 96mA; ComponentLink3Description: Package Specification; Code_JEDEC: MO-150-AH; ComponentLink1URL: www.analog.com; I/O Interface: Parallel, Serial; PackageDescription: 28-Lead Shrink Small Outline Package [SSOP]; ComponentLink2URL: http://www.analog.com/static/imported-files/data_sheets/AD9850.pdf; ComponentLink3URL: http://www.analog.com/static/imported-files/packages/32122249223724RS_28.pdf; ComponentLink2Description: Datasheet; PackageVersion: revA, 1997; ComponentLink1Description: Manufacturer URL; PackageReference: RS-28; DatasheetVersion: Rev. H
U8 = CMP-0004-00364-1: 128 Tap Digital Potentiometer with I2C Interface, -40 to 125 degC, 6-pin SOT23 (DCK6), Green (RoHS & no Sb/Br); Manufacturer: Texas Instruments; INL(Max)(+/-LSB): 0.5; Settling Time(us): 0.152; DNL(Max)(+/-LSB): 0.25; Mounting Technology: Surface Mount; DatasheetVersion: SLIS144A; ComponentLink2Description: Datasheet; Eco-Plan: Green (RoHS & no Sb/Br); PackageReference: DCK6; PartNumber: TPL0401A-10DCKR; ComponentLink1Description: Manufacturer URL; Interface: I2C; SubFamily: Digital Potentiometer; PackageDescription: 6-Pin Plastic Small Outline, Body 2 x 1.25 mm, Pitch 0.65 mm; ComponentLink1URL: http://www.ti.com/; Code_JEDEC: MO-203; ComponentLink3Description: Package Specification; ComponentLink2URL: http://www.ti.com/general/docs/lit/getliterature.tsp?genericPartNumber=TPL0401A-10&fileType=pdf; ComponentLink3URL: http://www.ti.com/litv/pdf/mpds114c; PackageVersion: 4093553-4/G, 01/2007
Y1 = CMP-03913-116855802-1: 830207044109 WE-SPXO Crystal Oscillator; Frequency: 100MHz; NexarPartId: 116855802; Length: 3.2mm; Width: 2.5mm; Max Operating Temperature: 85°C; Height: 1.2mm; Min Operating Temperature: -40°C

## Sheet PA stage 1.SchDoc
size A; SheetNumber: 9; SheetTotal: 12
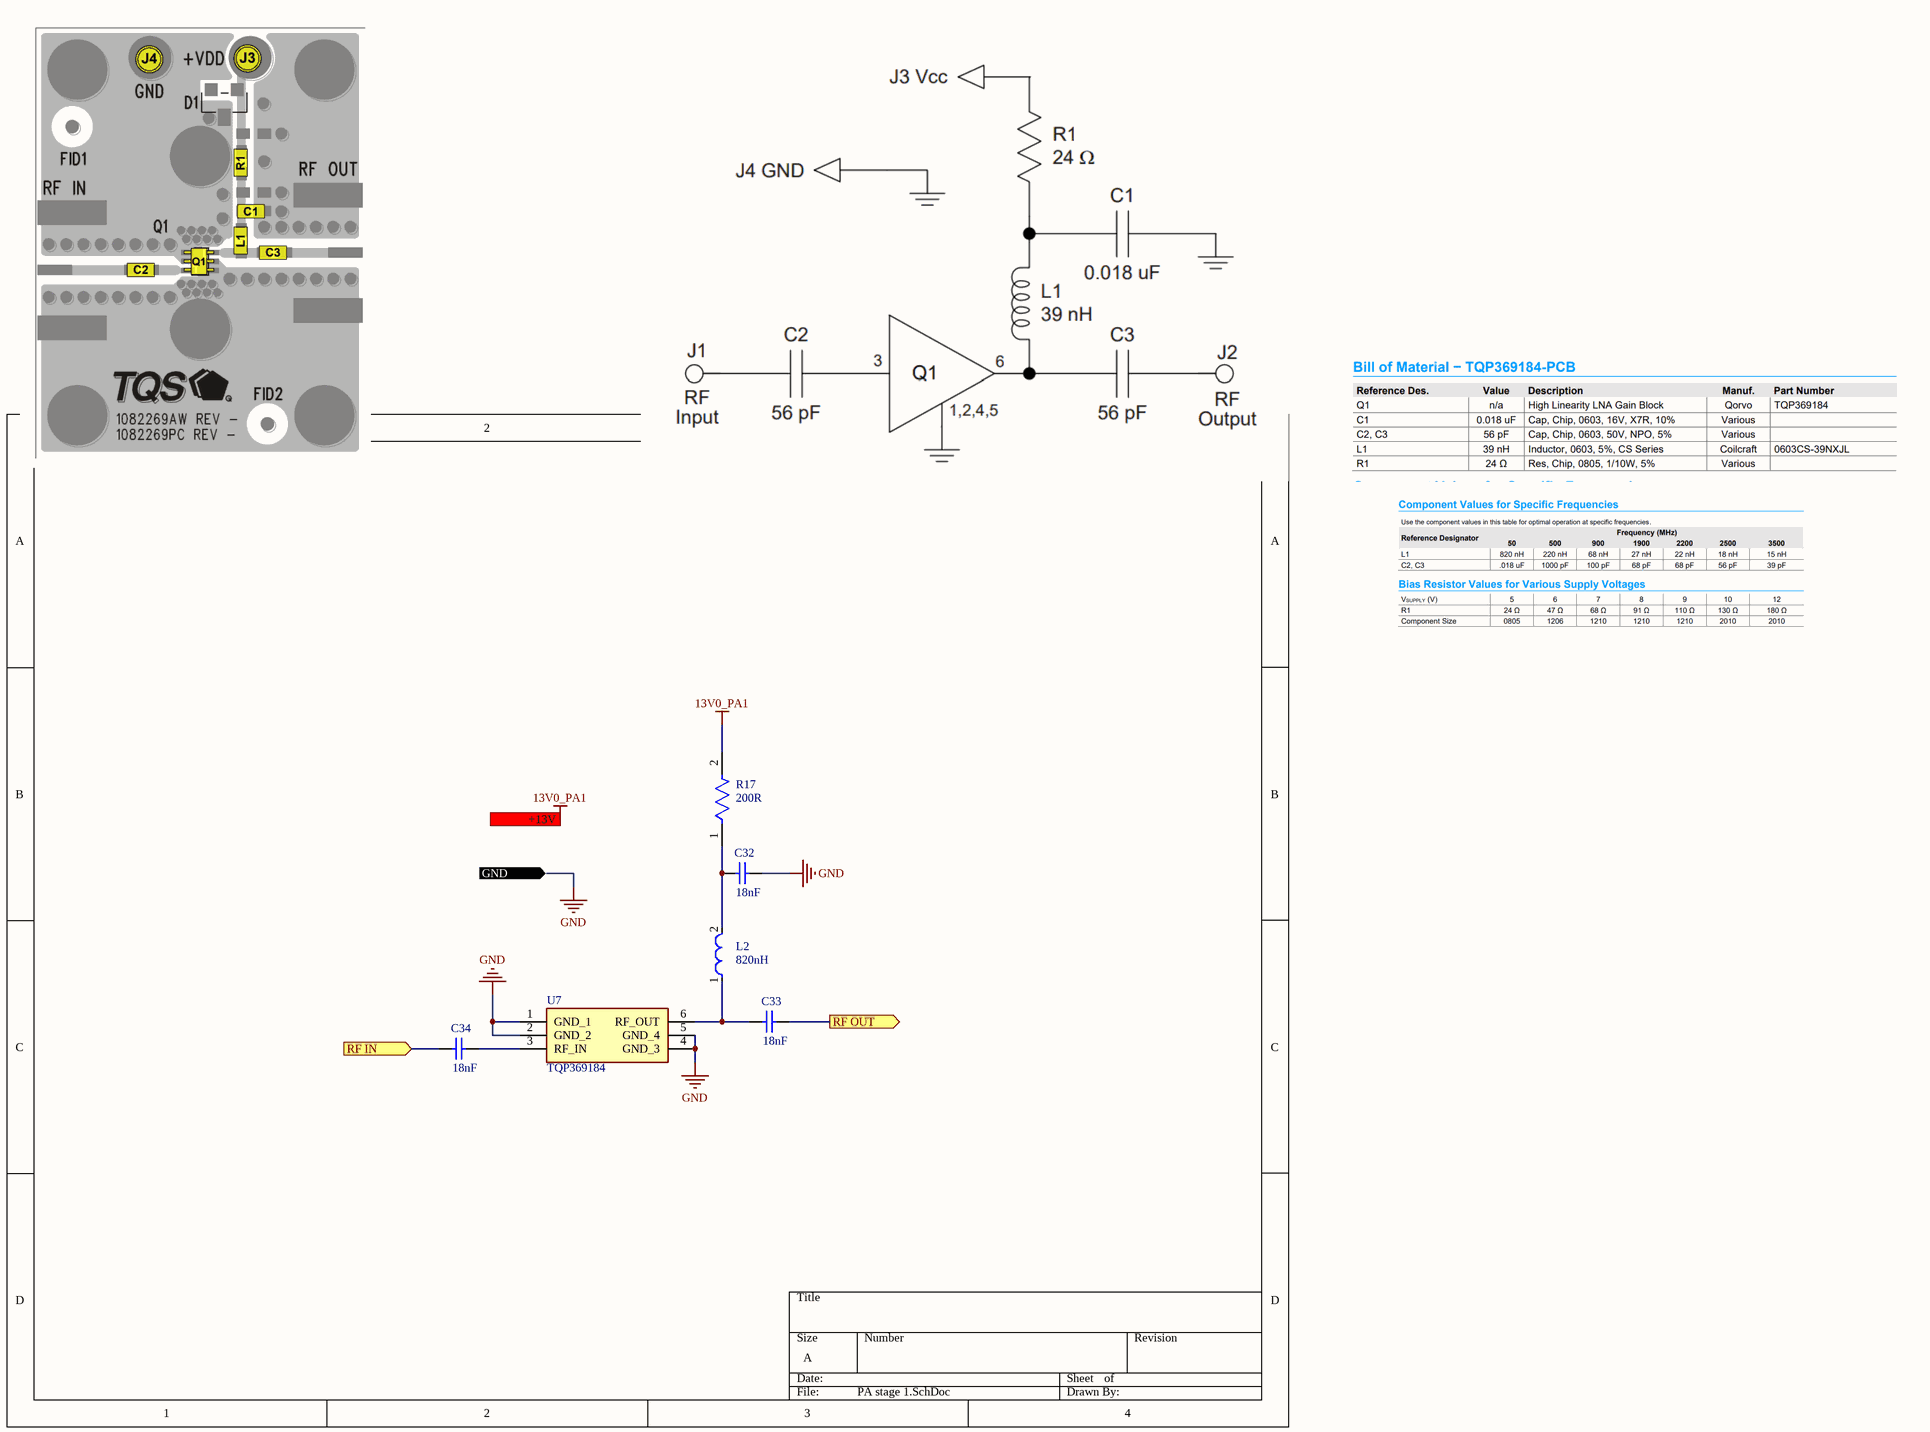
[diagram p3: PA stage 1.SchDoc]

### Parts
C32  Capacitance: 18nF  [CAPC1608X92X38ML15T08]  (hidden comment: VJ0603Y183KXAAC)
C33  value 18nF  [CAPC1608X92X38ML15T08]  (hidden comment: VJ0603Y183KXAAC)
C34  value 18nF  [CAPC1608X92X38ML15T08]  (hidden comment: VJ0603Y183KXAAC)
L2  Inductance: 820nH  [FP-LQM18NN_00-IPC_B]  (hidden comment: LQM18NNR82K00D)
R17  Resistance: 200R  [FP-RMCF2512-IPC_C]  (hidden comment: RMCF2512JT200R)
U7  TQP369184  [SOT65P210X110-6N]

### Ports
+13V (in), GND (in), RF IN (in), RF OUT (out)

### Nets
13V0_PA1: R17.2 ; port +13V  [project net PA1_VDD]
GND: C32.2 U7.1(GND_1) U7.2(GND_2) U7.4(GND_3) U7.5(GND_4) ; port GND
NetC32_1: C32.1 L2.2 R17.1
NetC33_1: C33.1 L2.1 U7.6(RF_OUT)
NetC33_2: C33.2 ; port RF OUT
NetC34_1: C34.1 ; port RF IN
NetC34_2: C34.2 U7.3(RF_IN)

### Library data of the parts
C32-C34 = CMP-2006-01326-1: Manufacturer: Vitramon; Part Number: VJ0603Y183KXAAC
L2 = CMP-06042-016197-1: Multilayer Type Inductor for General Circuits, 0603 (1608), 820nH, 10%, 2.1Ω, 35mA; Self Resonant Frequency: 85MHz; Shielding: Shielded; DC Resistance (DCR): 2.1R; Test Frequency: 25MHz; Core Material: Ferrite; Q Factor: 15; RoHS Compliant: Yes; Length: 1.6mm; Max Operating Temperature: 85°C; Case Code (Metric): 1608; Lead Free: Lead Free; Package Quantity: 1; Series: LQM18N; Height - Seated (Max): 0.037inch; Current Rating: 35mA; Radiation Hardening: No; REACH SVHC: No SVHC; Termination: SMD/SMT; Case Code (Imperial): 0603; Width: 0.031inch; Height: 0.8mm; Tolerance: 10%; Military Standard: Not; Mount: Surface Mount; Max DC Current: 35mA; Depth: 0.95mm; Min Operating Temperature: -40°C; DC Current: 35mA; Case/Package: 0603; Packaging: Tape and Reel
R17 = CMP-26527-000574-1: 200Ω ±5% 1W 2512 Thick Film Chip Resistor AEC-Q200 compliant; Temperature Coefficient: 200ppm/°C; Max Power Dissipation: 1W; Case Code (Imperial): 2512; Size Code: 2512; Case Code (Metric): 6432; Max Operating Temperature: 155°C; Military Standard: Not; Mount: Surface Mount; Radiation Hardening: No; Packaging: Tape and Reel; RoHS Compliant: Yes; Lead Free: Lead Free; Features: Automotive AEC-Q200; Contact Plating: Tin; Width: 0.126inch; Depth: 3.2mm; Case/Package: 2512; Construction: Rectangular; Min Operating Temperature: -55°C; Height: 0.028inch; Tolerance: 5%; Series: RMCF; Length: 0.248inch; Number of Terminations: 2; Power Rating: 1W; Resistor Type: Thick Film
U7 = TQP369184: DC  6 GHz Gain Block; Manufacturer_Name: Qorvo; Geometry.Height: 1.1mm; Mouser Part Number: 772-TQP369184; Mouser Price/Stock: https://www.mouser.co.uk/ProductDetail/Qorvo/TQP369184?qs=opBjA1TV900HByuIeJCWsQ%3D%3D; Manufacturer_Part_Number: TQP369184; Datasheet Link: https://www.qorvo.com/products/d/da005471

## Sheet PA stage 2.SchDoc
size A; SheetNumber: 11; SheetTotal: 12
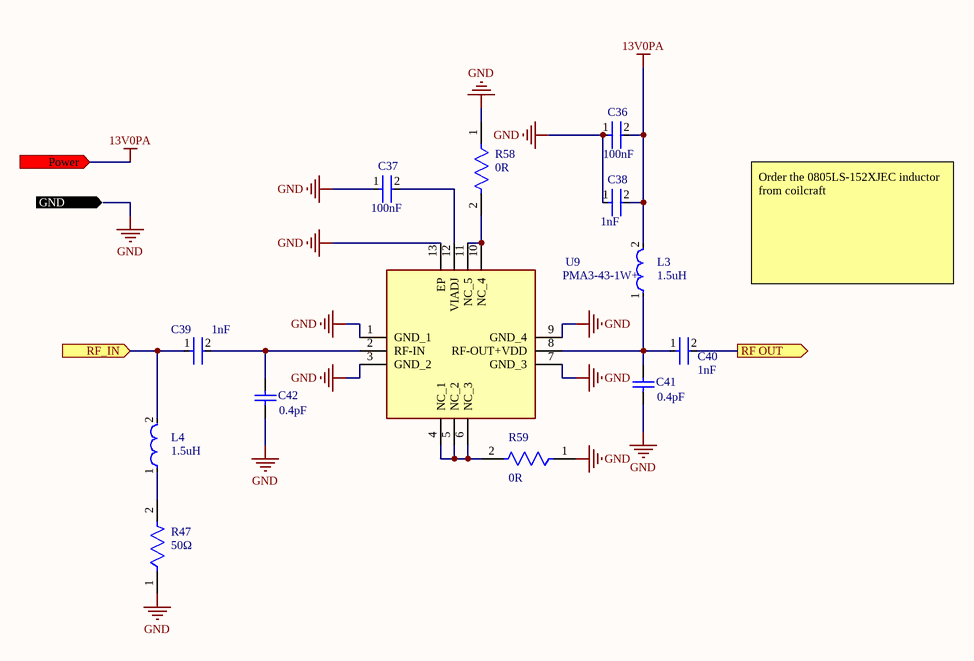
[diagram p4: PA stage 2.SchDoc]

### Parts
C36  Capacitance: 100nF  [FP-GRM155-0_05-IPC_B]  (hidden comment: GRM155R71H104KE14D)
C37  Capacitance: 100nF  [FP-GRM155-0_05-IPC_B]  (hidden comment: GRM155R71H104KE14D)
C38  Capacitance: 1nF  [FP-GRM155-0_05-IPC_B]  (hidden comment: GRM1555C1H102JA01D)
C39  Capacitance: 1nF  [FP-GRM155-0_05-IPC_B]  (hidden comment: GRM1555C1H102JA01D)
C40  Capacitance: 1nF  [FP-GRM155-0_05-IPC_B]  (hidden comment: GRM1555C1H102JA01D)
C41  value 0.4pF  [CAPC1005X55X25LL05T10]  (hidden comment: GRM1555C1HR40WA01D)
C42  value 0.4pF  [CAPC1005X55X25LL05T10]  (hidden comment: GRM1555C1HR40WA01D)
L3  Inductance: 1.5uH  [FP-LQW21HN_00-MFG]  (hidden comment: 0805LS-152XJEC)
L4  Inductance: 1.5uH  [FP-LQW21HN_00-MFG]  (hidden comment: LQW21HN1R5J00L)
R47  Resistance: 50Ω  [FP-FC0402-MFG]  (hidden comment: FCHP0402E50R0BBT1)
R58  Resistance: 0R  [FP-RMCF0603-IPC_B]  (hidden comment: RMCF0603ZG0R00)
R59  Resistance: 0R  [FP-RMCF0603-IPC_B]  (hidden comment: RMCF0603ZG0R00)
U9  PMA3-43-1W+  [QFN51P300X300X89-13N]

### Ports
GND (in), Power (in), RF OUT (out), RF_IN (in)

### Nets
13V0PA: C36.2 C38.2 L3.2 ; port Power
GND: C36.1 C37.1 C38.1 C41.1 C42.1 R47.1 R58.1 R59.1 U9.1(GND_1) U9.3(GND_2) U9.7(GND_3) U9.9(GND_4) U9.13(EP) ; port GND
PA2_OUT: C40.2 ; port RF OUT
NetC37_2: C37.2 U9.12(VIADJ)
NetC39_1: C39.1 L4.2 ; port RF_IN
NetC39_2: C39.2 C42.2 U9.2(RF-IN)
NetC40_1: C40.1 C41.2 L3.1 U9.8(RF-OUT+VDD)
NetL4_1: L4.1 R47.2
NetR58_2: R58.2 U9.10(NC_4) U9.11(NC_5)
NetR59_2: R59.2 U9.4(NC_1) U9.5(NC_2) U9.6(NC_3)

### Notes on the sheet
- Order the 0805LS-152XJEC inductor from coilcraft

### Library data of the parts
C36 C37 = CMP-2008-04639-2: Chip Multilayer Ceramic Capacitors for General Purpose, 0402, 0.10uF, X7R, 15%, 10%, 50V; Dissipation Factor: 0.025%; Weight: 0.000212oz; Thickness: 0.022inch; Voltage Rating (DC): 50V; Dielectric Material: Ceramic; Termination: SMD/SMT; Case/Package: 0402; Case Code (Imperial): 0402; Mount: Surface Mount; REACH SVHC: No SVHC; Resistor Type: Ceramic; Dielectric: X7R; Max Operating Temperature: 125°C; Voltage: 50V; Lead Free: Lead Free; Package Quantity: 10000; Packaging: Tape and Reel; Length: 1mm; Material: Ceramic; Height: 0.5mm; Depth: 0.5mm; Width: 0.5mm; Min Operating Temperature: -55°C; Tolerance: 10%; Case Code (Metric): 1005; Voltage Rating: 50V
C38-C40 = CMP-2008-04254-2: Chip Multilayer Ceramic Capacitors for General Purpose, 0402, 1000pF, C0G, 30ppm/°C, 5%, 50V; Insulation Resistance: 10GR; Packaging: Tape and Reel; Lead Free: Lead Free; Tolerance: 5%; Temperature Coefficient: 30ppm/°C; Thickness: 0.022inch; Termination: SMD/SMT; Max Operating Temperature: 125°C; Height: 0.5mm; Package Quantity: 1; Radiation Hardening: No; Material: Ceramic; Case Code (Metric): 1005; Number of Pins: 2; Voltage Rating: 50V; Mount: Surface Mount; Voltage: 50V; Case/Package: 0402; Min Operating Temperature: -55°C; Dielectric Material: Ceramic; Width: 0.5mm; Depth: 0.5mm; Case Code (Imperial): 0402; REACH SVHC: No SVHC; Dielectric: C0G; Voltage Rating (DC): 50V; Length: 1mm
C41 C42 = CMP-1034-00010-2: Manufacturer: Murata; Part Number: GRM1555C1HR40WA01D
L3 = CMP-06042-001639-1: 0805LS-152XJEC Coilcraft; Core Material: Ferrite; DC Current: 85mA; DC Resistance (DCR): 5.33R; Self Resonant Frequency: 350MHz; Shielding: Unshielded; Test Frequency: 10MHz; Tolerance: 5%; Q Factor: 35; Width: 0.047inch; Case Code (Metric): 2012; Current Rating: 85mA; Mount: Surface Mount; Max DC Current: 85mA; Length: 2mm; Height - Seated (Max): 0.039inch; Depth: 1.4mm; Min Operating Temperature: -40°C; Termination: SMD/SMT; Military Standard: Not; Radiation Hardening: No; Packaging: Tape and Reel; Resistor Type: Wirewound; Case/Package: 0805; Case Code (Imperial): 0805; Weight: 0.000282oz; Height: 0.9mm; Package Quantity: 3000; Max Operating Temperature: 85°C
L4 = CMP-06042-001639-1: Wire Wound Ferrite type RF Inuctor 1.5uH ±5% 85mA 5.33Ω 0805 (2012); DC Resistance (DCR): 5.33R; Self Resonant Frequency: 350MHz; Shielding: Unshielded; Test Frequency: 10MHz; Q Factor: 35; Width: 0.047inch; Core Material: Ferrite; Case Code (Metric): 2012; DC Current: 85mA; Current Rating: 85mA; Mount: Surface Mount; Max DC Current: 85mA; Length: 2mm; Height - Seated (Max): 0.039inch; Depth: 1.4mm; Min Operating Temperature: -40°C; Termination: SMD/SMT; Military Standard: Not; Radiation Hardening: No; Packaging: Tape and Reel; Resistor Type: Wirewound; Case/Package: 0805; Case Code (Imperial): 0805; Weight: 0.000282oz; Height: 0.9mm; Package Quantity: 3000; Max Operating Temperature: 85°C; Tolerance: 5%
R47 = CMP-05494-120702529-1: FCHP0402E50R0BBT1 SMD Chip Resistor, 50 Ohm, ± 0.1%, 1 W, 0402 [1005 Metric], Thin Film, High Frequency; Power Rating: 1W; Voltage Rating: 30V; Temperature Coefficient: 25ppm/°C; Max Operating Temperature: 155°C; Min Operating Temperature: -55°C; Composition: Thin Film; Schedule B: 8533210045; Case/Package: 0402; Tolerance: 0.1%; Height: 419.1µm; NexarPartId: 120702529
R58 R59 = CMP-26527-006412-1: as R8 on sheet System; Width: 0.031inch; RoHS Compliant: Yes; Number of Terminations: 2; Case/Package: 0603; Contact Plating: Tin; Height: 0.022inch; Resistor Type: Thick Film; Mount: Surface Mount; Length: 0.061inch; Features: Automotive AEC-Q200; Series: RMCF; Max Operating Temperature: 155°C; Radiation Hardening: No; Min Operating Temperature: -55°C; Packaging: Tape and Reel
U9 = PMA3-43-1W+: Integrated Circuit; Manufacturer_Name: Mini-Circuits; Datasheet Link: https://www.minicircuits.com/pdfs/PMA3-43-1W+.pdf; Height: 0.89mm; Manufacturer_Part_Number: PMA3-43-1W+

## Sheet LDO.SchDoc
size A; SheetNumber: 9; SheetTotal: 12
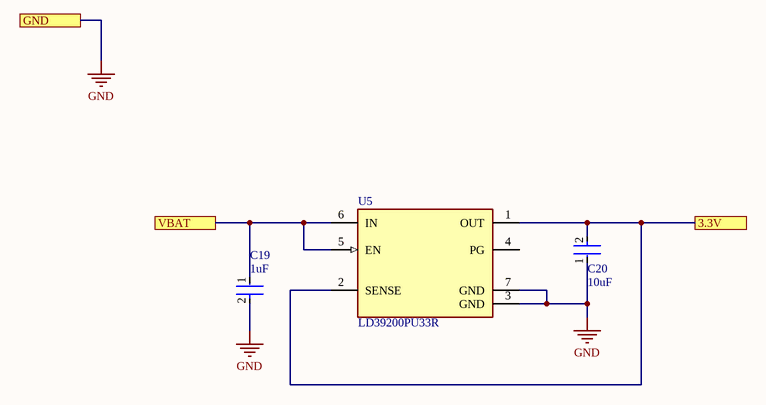
[diagram p5: LDO.SchDoc]

### Parts
C19  Capacitance: 1uF  [FP-C1608-080-0_1-IPC_B]  (hidden comment: C1608X5R1H105K080AB)
C20  Capacitance: 10uF  [FP-C1608-080-0_1-MFG]  (hidden comment: C1608X5R1A106K080AC)
U5  LD39200PU33R  [FP-DFN6-7946637-MFG]

### Ports
3.3V, GND, VBAT

### Nets
3V3: C20.2 U5.1(OUT) U5.2(SENSE) ; port 3.3V
GND: C19.2 C20.1 U5.3(GND) U5.7(GND) ; port GND
VBAT: C19.1 U5.5(EN) U5.6(IN) ; port VBAT

Not connected (* = marked no-connect by the designer): U5 4(PG)

### Library data of the parts
C19 = CMP-2000-06025-2: Multilayer Ceramic Capacitors 1μF ±10% 50V X5R SMD 0603; Lead Free: Lead Free; Height: 0.8mm; Mount: Surface Mount; Radiation Hardening: No; Thickness: 0.035inch; Length: 1.6mm; Max Operating Temperature: 85°C; REACH SVHC: No SVHC; Min Operating Temperature: -55°C; Construction: Flat; RoHS Compliant: Yes; Voltage Rating: 50V; Dielectric: X5R; Packaging: Tape and Reel; Termination: SMD/SMT; Voltage Rating (DC): 50V; Case Code (Imperial): 0603; Voltage: 50V; Width: 0.031inch; Weight: 7.1E-05oz; Depth: 0.8mm; Case Code (Metric): 1608; Series: C; Case/Package: 0603; Tolerance: 10%; Resistor Type: Ceramic; Number of Pins: 2; Dielectric Material: Ceramic; Package Quantity: 1
C20 = CMP-2000-04979-3: as C1 on sheet MCU; Dielectric Material: Ceramic; Construction: Flat; Height: 0.8mm; Thickness: 0.035inch; Case Code (Metric): 1608; Radiation Hardening: No; Number of Pins: 2; Voltage Rating (DC): 10V; Depth: 0.8mm; Voltage: 10V; RoHS Compliant: Yes; Voltage Rating: 10V; Package Quantity: 1; Resistor Type: Ceramic; Termination: SMD/SMT; Lead Free: Lead Free; REACH SVHC: No SVHC; Tolerance: 10%; Mount: Surface Mount; Series: C; Packaging: Tape and Reel; Width: 0.8mm; Dielectric: X5R; Weight: 7.1E-05oz; Length: 1.6mm; Max Operating Temperature: 85°C; Case Code (Imperial): 0603; Case/Package: 0603; Min Operating Temperature: -55°C
U5 = CMP-12153-000011-1: IC REG LINEAR 3.3V 2A 6DFN; Number of Outputs: 1; Max Input Voltage: 6V; Output Type: Fixed; Min Input Voltage: 1.25V; Dropout Voltage: 130mV; Operating Supply Current: 1mA; Number of Regulators: 1; Case/Package: DFN; Packaging: Tape and Reel; Output Current: 2A; Min Operating Temperature: -40°C; Mount: Surface Mount; Output Voltage: 3.3V; Max Operating Temperature: 125°C; Lead Free: Lead Free; Package Quantity: 3000

## Sheet Boost 12V.SchDoc
size A4; SheetNumber: 3; SheetTotal: 11
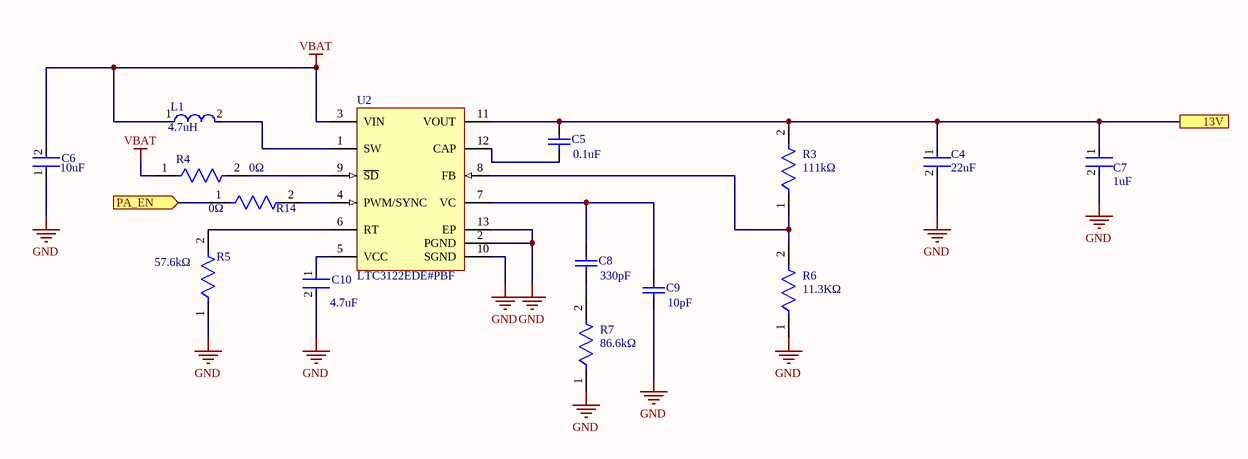
[diagram p6: Boost 12V.SchDoc]

### Parts
C4  Capacitance: 22uF  [FP-CC0805-0_2-1_45-IPC_C]  (hidden comment: CC0805MKX5R8BB226)
C5  value 0.1uF  [CAPC1608X92X38NL15T08]  (hidden comment: VJ0603Y104KXJAP)
C6  Capacitance: 10uF  [FP-C1608-080-0_1-MFG]  (hidden comment: C1608X5R1A106K080AC)
C7  Capacitance: 1uF  [FP-C1608-080-0_1-IPC_B]  (hidden comment: C1608X5R1H105K080AB)
C8  value 330pF  [CAPC1608X87X35NL15T15]  (hidden comment: C0603C331J5GALTU)
C9  value 10pF  [CAPC1608X92X38ML12T08]  (hidden comment: VJ0603A100KXAAC)
C10  Capacitance: 4.7uF  [FP-C2012-125-0_2-MFG]  (hidden comment: C2012X5R1E475K125AB)
L1  Inductance: 4.7uH  [FP-IHLP-1616BZ-FP_1_8545x-MFG]  (hidden comment: IHLP1616BZER4R7M11)
R3  Resistance: 111kΩ  [FP-CRCW0603-e3-IPC_A]  (hidden comment: RN73H1JTTD1113D25)
R4  Resistance: 0Ω  [FP-RMCF0603-IPC_B]  (hidden comment: RMCF0603ZG0R00)
R5  Resistance: 57.6kΩ  [FP-CRCW0603-e3-MFG]  (hidden comment: CRCW060357K6FKEA)
R6  value 11.3KΩ  [FP-AC0603-IPC_C]  (hidden comment: AC0603FR-1311K3L)
R7  Resistance: 86.6kΩ  [FP-CRCW0603-HPe3-MFG]  (hidden comment: CRCW060386K6FKEAHP)
R14  Resistance: 0Ω  [FP-RMCF0603-IPC_B]  (hidden comment: RMCF0603ZG0R00)
U2  LTC3122EDE#PBF  [LT-DE-UE-12_V]

### Ports
13V, PA_EN (in)

### Nets
13V0: C4.1 C5.2 C7.1 R3.2 U2.11(VOUT) ; port 13V
GND: C4.2 C6.1 C7.2 C9.1 C10.2 R5.1 R6.1 R7.1 U2.2(PGND) U2.10(SGND) U2.13(EP)
VBAT: C6.2 L1.1 R4.1 U2.3(VIN)
NetC5_1: C5.1 U2.12(CAP)
NetC8_1: C8.1 R7.2
NetC8_2: C8.2 C9.2 U2.7(VC)
NetC10_1: C10.1 U2.5(VCC)
NetL1_2: L1.2 U2.1(SW)
NetR3_1: R3.1 R6.2 U2.8(FB)
NetR4_2: R4.2 U2.9(~{SD})
NetR5_2: R5.2 U2.6(RT)
NetR14_1: R14.1 ; port PA_EN
NetR14_2: R14.2 U2.4(PWM/SYNC)

### Library data of the parts
C4 = CMP-03422-001497-1: CAP CER 22UF 25V X5R 0805; Tolerance: 20%; Max Operating Temperature: 85°C; Dielectric: X5R; Termination: SMD/SMT; Voltage Rating: 25V; Width: 0.049inch; Min Operating Temperature: -55°C; Case/Package: 0805; Lead Free: Lead Free; RoHS Compliant: Yes; Weight: 0.000194oz; Voltage Rating (DC): 25V; Length: 0.079inch; Halogen Free: Halogen Free; Height: 1.25mm; Packaging: Tape and Reel; Package Quantity: 3000; Case Code (Metric): 2012; Thickness: 0.057inch; Case Code (Imperial): 0805; Mount: Surface Mount
C5 = CMP-2006-01211-1: Manufacturer: Vitramon; Part Number: VJ0603Y104KXJAP
C6 = CMP-2000-04979-3: as C1 on sheet MCU; Dielectric Material: Ceramic; Construction: Flat; Height: 0.8mm; Thickness: 0.035inch; Case Code (Metric): 1608; Radiation Hardening: No; Number of Pins: 2; Voltage Rating (DC): 10V; Depth: 0.8mm; Voltage: 10V; RoHS Compliant: Yes; Voltage Rating: 10V; Package Quantity: 1; Resistor Type: Ceramic; Termination: SMD/SMT; Lead Free: Lead Free; REACH SVHC: No SVHC; Tolerance: 10%; Mount: Surface Mount; Series: C; Packaging: Tape and Reel; Width: 0.8mm; Dielectric: X5R; Weight: 7.1E-05oz; Length: 1.6mm; Max Operating Temperature: 85°C; Case Code (Imperial): 0603; Case/Package: 0603; Min Operating Temperature: -55°C
C7 = CMP-2000-06025-2: as C19 on sheet LDO; Lead Free: Lead Free; Height: 0.8mm; Mount: Surface Mount; Radiation Hardening: No; Thickness: 0.035inch; Length: 1.6mm; Max Operating Temperature: 85°C; REACH SVHC: No SVHC; Min Operating Temperature: -55°C; Construction: Flat; RoHS Compliant: Yes; Voltage Rating: 50V; Dielectric: X5R; Packaging: Tape and Reel; Termination: SMD/SMT; Voltage Rating (DC): 50V; Case Code (Imperial): 0603; Voltage: 50V; Width: 0.031inch; Weight: 7.1E-05oz; Depth: 0.8mm; Case Code (Metric): 1608; Series: C; Case/Package: 0603; Tolerance: 10%; Resistor Type: Ceramic; Number of Pins: 2; Dielectric Material: Ceramic; Package Quantity: 1
C8 = CMP-2006-03564-1: Manufacturer: Kemet; Part Number: C0603C331J5GALTU
C9 = CMP-2006-02012-1: Manufacturer: Vitramon; Part Number: VJ0603A100KXAAC
C10 = CMP-08246-004908-1: Multilayer Ceramic Capacitors 4.7μF ±10% 25V X5R SMD 0805; Lead Free: Lead Free; Thickness: 0.057inch; Packaging: Tape and Reel; Min Operating Temperature: -55°C; RoHS Compliant: Yes; Dielectric: X5R; Weight: 0.000194oz; REACH SVHC: No SVHC; Voltage Rating (DC): 25V; Mount: Surface Mount; Resistor Type: Ceramic; Termination: SMD/SMT; Number of Pins: 2; Case Code (Imperial): 0805; Dielectric Material: Ceramic; Voltage: 25V; Voltage Rating: 25V; Case Code (Metric): 2012; Case/Package: 0805; Max Operating Temperature: 85°C; Height: 1.25mm; Tolerance: 10%; Depth: 1.25mm; Package Quantity: 1; Length: 2mm; Radiation Hardening: No; Width: 1.25mm
L1 = CMP-02424-000576-1: Fixed Inductors Commercial Low DCR Series SMT 4.7uH 1.7A 105mΩ 20%; Saturation Current: 1.75A; Test Frequency: 100kHz; Shielding: Shielded; Self Resonant Frequency: 29MHz; Core Material: Ferrite; DC Resistance (DCR): 105mR; Width: 4.06mm; Depth: 4.31mm; Height: 2mm; Case/Package: 1616; Max DC Current: 1.7A; Max Operating Temperature: 125°C; Inductance Tolerance: 20%; Current Rating: 1.7A; Package Quantity: 4000; Tolerance: 20%; Length: 4.7mm; Contact Plating: Tin; RMS Current (Irms): 1.7A; Packaging: Tape and Reel; Height - Seated (Max): 0.079inch; Military Standard: Not; Termination: SMD/SMT; Mount: Surface Mount; Number of Pins: 1616; Min Operating Temperature: -55°C; Lead Free: Lead Free; Radiation Hardening: No
R3 = CMP-2000-03018-2: RES 111K OHM 0.5% 1/10W 0603; Tolerance: 1%; Voltage Rating (DC): 75V; Power Rating: 100mW; Temperature Coefficient: 100ppm/°C; Features: Automotive AEC-Q200; Depth: 0.85mm; Max Operating Temperature: 155°C; Package Quantity: 10; Length: 1.55mm; Mount: Surface Mount; Termination: SMD/SMT; Width: 0.033inch; Min Operating Temperature: -55°C; Composition: Thick Film; Max Power Dissipation: 100mW; Case Code (Imperial): 0603; Case/Package: 0603; Voltage Rating: 75V; Contact Plating: Tin; Case Code (Metric): 1608; Weight: 7.1E-05oz; Lead Free: Lead Free; Height: 0.02inch; Military Standard: Not; Number of Terminations: 2; Radiation Hardening: No; Packaging: Tape and Reel
R4 R14 = CMP-26527-006412-1: as R8 on sheet System; Width: 0.031inch; RoHS Compliant: Yes; Number of Terminations: 2; Case/Package: 0603; Contact Plating: Tin; Height: 0.022inch; Resistor Type: Thick Film; Mount: Surface Mount; Length: 0.061inch; Features: Automotive AEC-Q200; Series: RMCF; Max Operating Temperature: 155°C; Radiation Hardening: No; Min Operating Temperature: -55°C; Packaging: Tape and Reel
R5 = CMP-2000-03475-2: RES Thick Film, 57.6kΩ, 1%, 0.1W, 100ppm/°C, 0603; Voltage Rating: 75V; Power Rating: 100mW; Case Code (Metric): 1608; Length: 1.55mm; Weight: 7.1E-05oz; Case/Package: 0603; Features: Automotive AEC-Q200; Contact Plating: Tin; Temperature Coefficient: 100ppm/°C; Number of Terminations: 2; Packaging: Tape and Reel; Package Quantity: 10; Max Power Dissipation: 100mW; Depth: 0.85mm; Height: 0.45mm; Tolerance: 1%; Radiation Hardening: No; Composition: Thick Film; Width: 0.85mm; Min Operating Temperature: -55°C; Case Code (Imperial): 0603; Termination: SMD/SMT; Number of Pins: 2; Max Operating Temperature: 155°C; Military Standard: Not
R6 = CMP-03412-022585-2: RES 11.3KΩ 1.00% 0.1W 0603; RoHS Compliant: Yes
R7 = CMP-02407-006337-1: RES Thick Film, 86.6kΩ, 1%, 0.33W, 100ppm/°C, 0603; Max Power Dissipation: 250mW; Tolerance: 1%; Width: 0.033inch; Package Quantity: 5000; Composition: Thick Film; Number of Terminations: 2; Height: 0.022inch; Length: 0.063inch; Temperature Coefficient: 100ppm/°C; Packaging: Tape and Reel; Features: Automotive AEC-Q200; Lead Free: Lead Free; Case/Package: 0603
U2 = CMP-0492-00369-1: 2.5 A Synchronous Step-Up DC/DC Converter with Output Disconnect, 12-pin SON (DE-UE-12), -40 to 125 degC, Pb-Free; Manufacturer: Linear Technology; Number of Outputs: 1; ComponentLink2URL: http://cds.linear.com/docs/en/datasheet/3122fa.pdf; ComponentLink1URL: http://www.linear.com/; Code_JEDEC: MO-229; ComponentLink2Description: Datasheet; ComponentLink1Description: Manufacturer URL; PackageReference: DE-UE-12; PackageVersion: Rev. D, 06/2010; ComponentLink3Description: Package Specification; PackageDescription: 12-Pin Plastic DFN, Body 4 x 3 mm, Pitch 0.5 mm; PartNumber: LTC3122EDE#PBF; ComponentLink3URL: http://cds.linear.com/docs/en/packaging/DFN_12_05-08-1695.pdf; Mounting Technology: Surface Mount; RoHS: TRUE; DatasheetVersion: Rev. A

## Sheet Switch1.SchDoc
size A; SheetNumber: 6; SheetTotal: 11
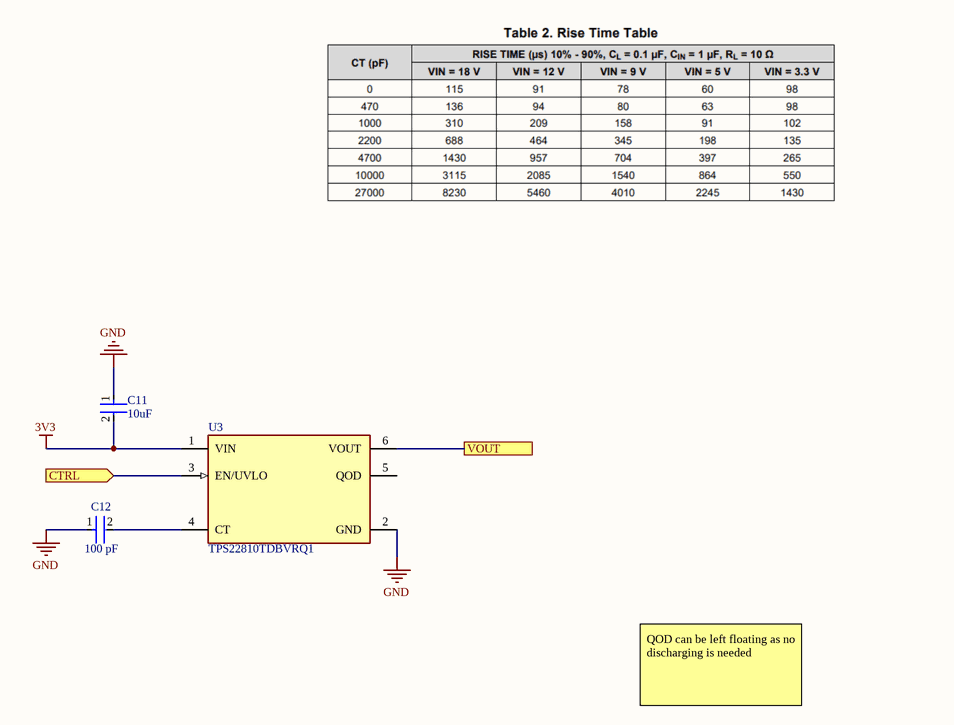
[diagram p7: Switch1.SchDoc]

### Parts
C11  value 10uF  [FP-C0603C106M8PACTU-MFG]  (hidden comment: C0603C106M8PACTU)
C12  Capacitance: 100 pF  [FP-C0603C-CF-MFG]  (hidden comment: C0603C101K4GAC7867)
U3  TPS22810TDBVRQ1  [FP-DBV0006A-MFG]

### Ports
CTRL (in), VOUT

### Nets
3V3: C11.2 U3.1(VIN)
3V3DDS: U3.6(VOUT) ; port VOUT
GND: C11.1 C12.1 U3.2(GND)
NetC12_2: C12.2 U3.4(CT)
NetU1_9: U3.3(EN/UVLO) ; port CTRL

Not connected (* = marked no-connect by the designer): U3 5(QOD)

### Notes on the sheet
- QOD can be left floating as no discharging is needed

### Library data of the parts
C11 = CMP-03020-034654-1: CAP CER 10UF 10V X5R 0603; RoHS Compliant: Yes
C12 = CMP-03020-014723-2: CAP CER 100PF 16V NP0 0603; Manufacturer: KEMET; Automotive Grade: Grade 1; Material: Ceramic; Temperature Characteristic: C0G; Temperature Coefficient: 30ppm/°C; Tolerance: 0.1; Category: Cap; Temperature Range High: +125°C; RoHS: TRUE; Device Class L2: Capacitors; Automotive: Yes; Height: 0.87mm; Value: 100 pF; ComponentLink2Description: Datasheet; Digikey Description: CAP CER 100PF 16V NP0 0603; Manufacturer Part Number: C0603C101K4GAC7867; ComponentLink2URL: https://api.kemet.com/component-edge/download/datasheet/C0603C100J5GACAUTO.pdf; Device Class L1: Passive Components; Device Class L3: Ceramic Capacitors; Temperature: -55°C to +125°C; Lead Free: Yes; Temperature Range Low: -55°C; Voltage Rating: 16 V; Package: C0603C-CF; Octopart: https://octopart.com/c0603c101k4gac7867-kemet-1494535
U3 = CMP-04910-000007-2: IC PWR SWITCH N-CHAN 1:1 SOT23-6; Max Output Current: 2A; Max Supply Voltage: 18V; Min Supply Voltage: 2.7V; Number of Outputs: 1; Output Configuration: High Side; Fault Protection: Over Temperature; Interface: On/Off; Weight: 0.000801oz; Case/Package: SOT-23-6; Series: TPS22810-Q1; Package Quantity: 3000; RoHS Compliant: Yes; Number of Channels: 1; Max Operating Temperature: 105°C; Packaging: Cut Tape; Min Operating Temperature: -40°C